# Altium project PCB_Project.PrjPcb
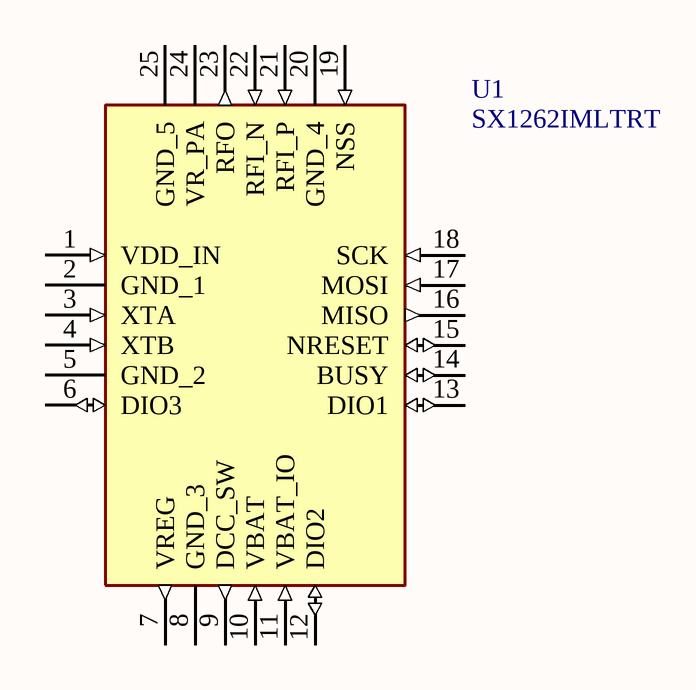
[diagram p0: RF-IC.SchDoc]
3 sheets, 1 parts. Net scope: global (net labels, ports and power ports of the same name join across sheets).
Board file: PCB1.PcbDoc
Sheets:
  RF-IC.SchDoc
  Power.SchDoc
  MCU.SchDoc

## Sheet RF-IC.SchDoc
size A4; SheetNumber: 1; SheetTotal: 3

### Parts
U1  SX1262IMLTRT  [QFN50P400X400X100-25N-D]

### Nets

Not connected (* = marked no-connect by the designer): U1 1(VDD_IN) 2(GND_1) 3(XTA) 4(XTB) 5(GND_2) 6(DIO3) 7(VREG) 8(GND_3) 9(DCC_SW) 10(VBAT) 11(VBAT_IO) 12(DIO2) 13(DIO1) 14(BUSY) 15(NRESET) 16(MISO) 17(MOSI) 18(SCK) 19(NSS) 20(GND_4) 21(RFI_P) 22(RFI_N) 23(RFO) 24(VR_PA) 25(GND_5)

### Library data of the parts
U1 = SX1262IMLTRT: Integrated Circuit; Manufacturer_Name: SEMTECH; Datasheet Link: http://www.mouser.com/datasheet/2/761/DS_SX1261-2_V1.1-1307803.pdf; Height: 1mm; Manufacturer_Part_Number: SX1262IMLTRT; Mouser Part Number: 947-SX1262IMLTRT; Mouser Price/Stock: https://www.mouser.co.uk/ProductDetail/Semtech/SX1262IMLTRT?qs=XFmntM7Yc9eYt6yxTPughQ%3D%3D; Arrow Part Number: SX1262IMLTRT; Arrow Price/Stock: https://www.arrow.com/en/products/sx1262imltrt/semtech.html?utm_currency=USD&region=nac

## Sheet Power.SchDoc
size A4; SheetNumber: 2; SheetTotal: 2

## Sheet MCU.SchDoc
size A4; SheetNumber: 3; SheetTotal: 3